# EasyEDA Pro project v0.9.0.epro, schematic main_5

## Sheets
1 main: Board Name: tf_mux-v0.0.8-rc4; Create Date: 2025-06-03; Page Name: main; Project Name: sd_mux; Schematic Name: main_2; Update Date: 2025-07-14; Company: Ling Wang; Page Size: A4; Version: V0.8
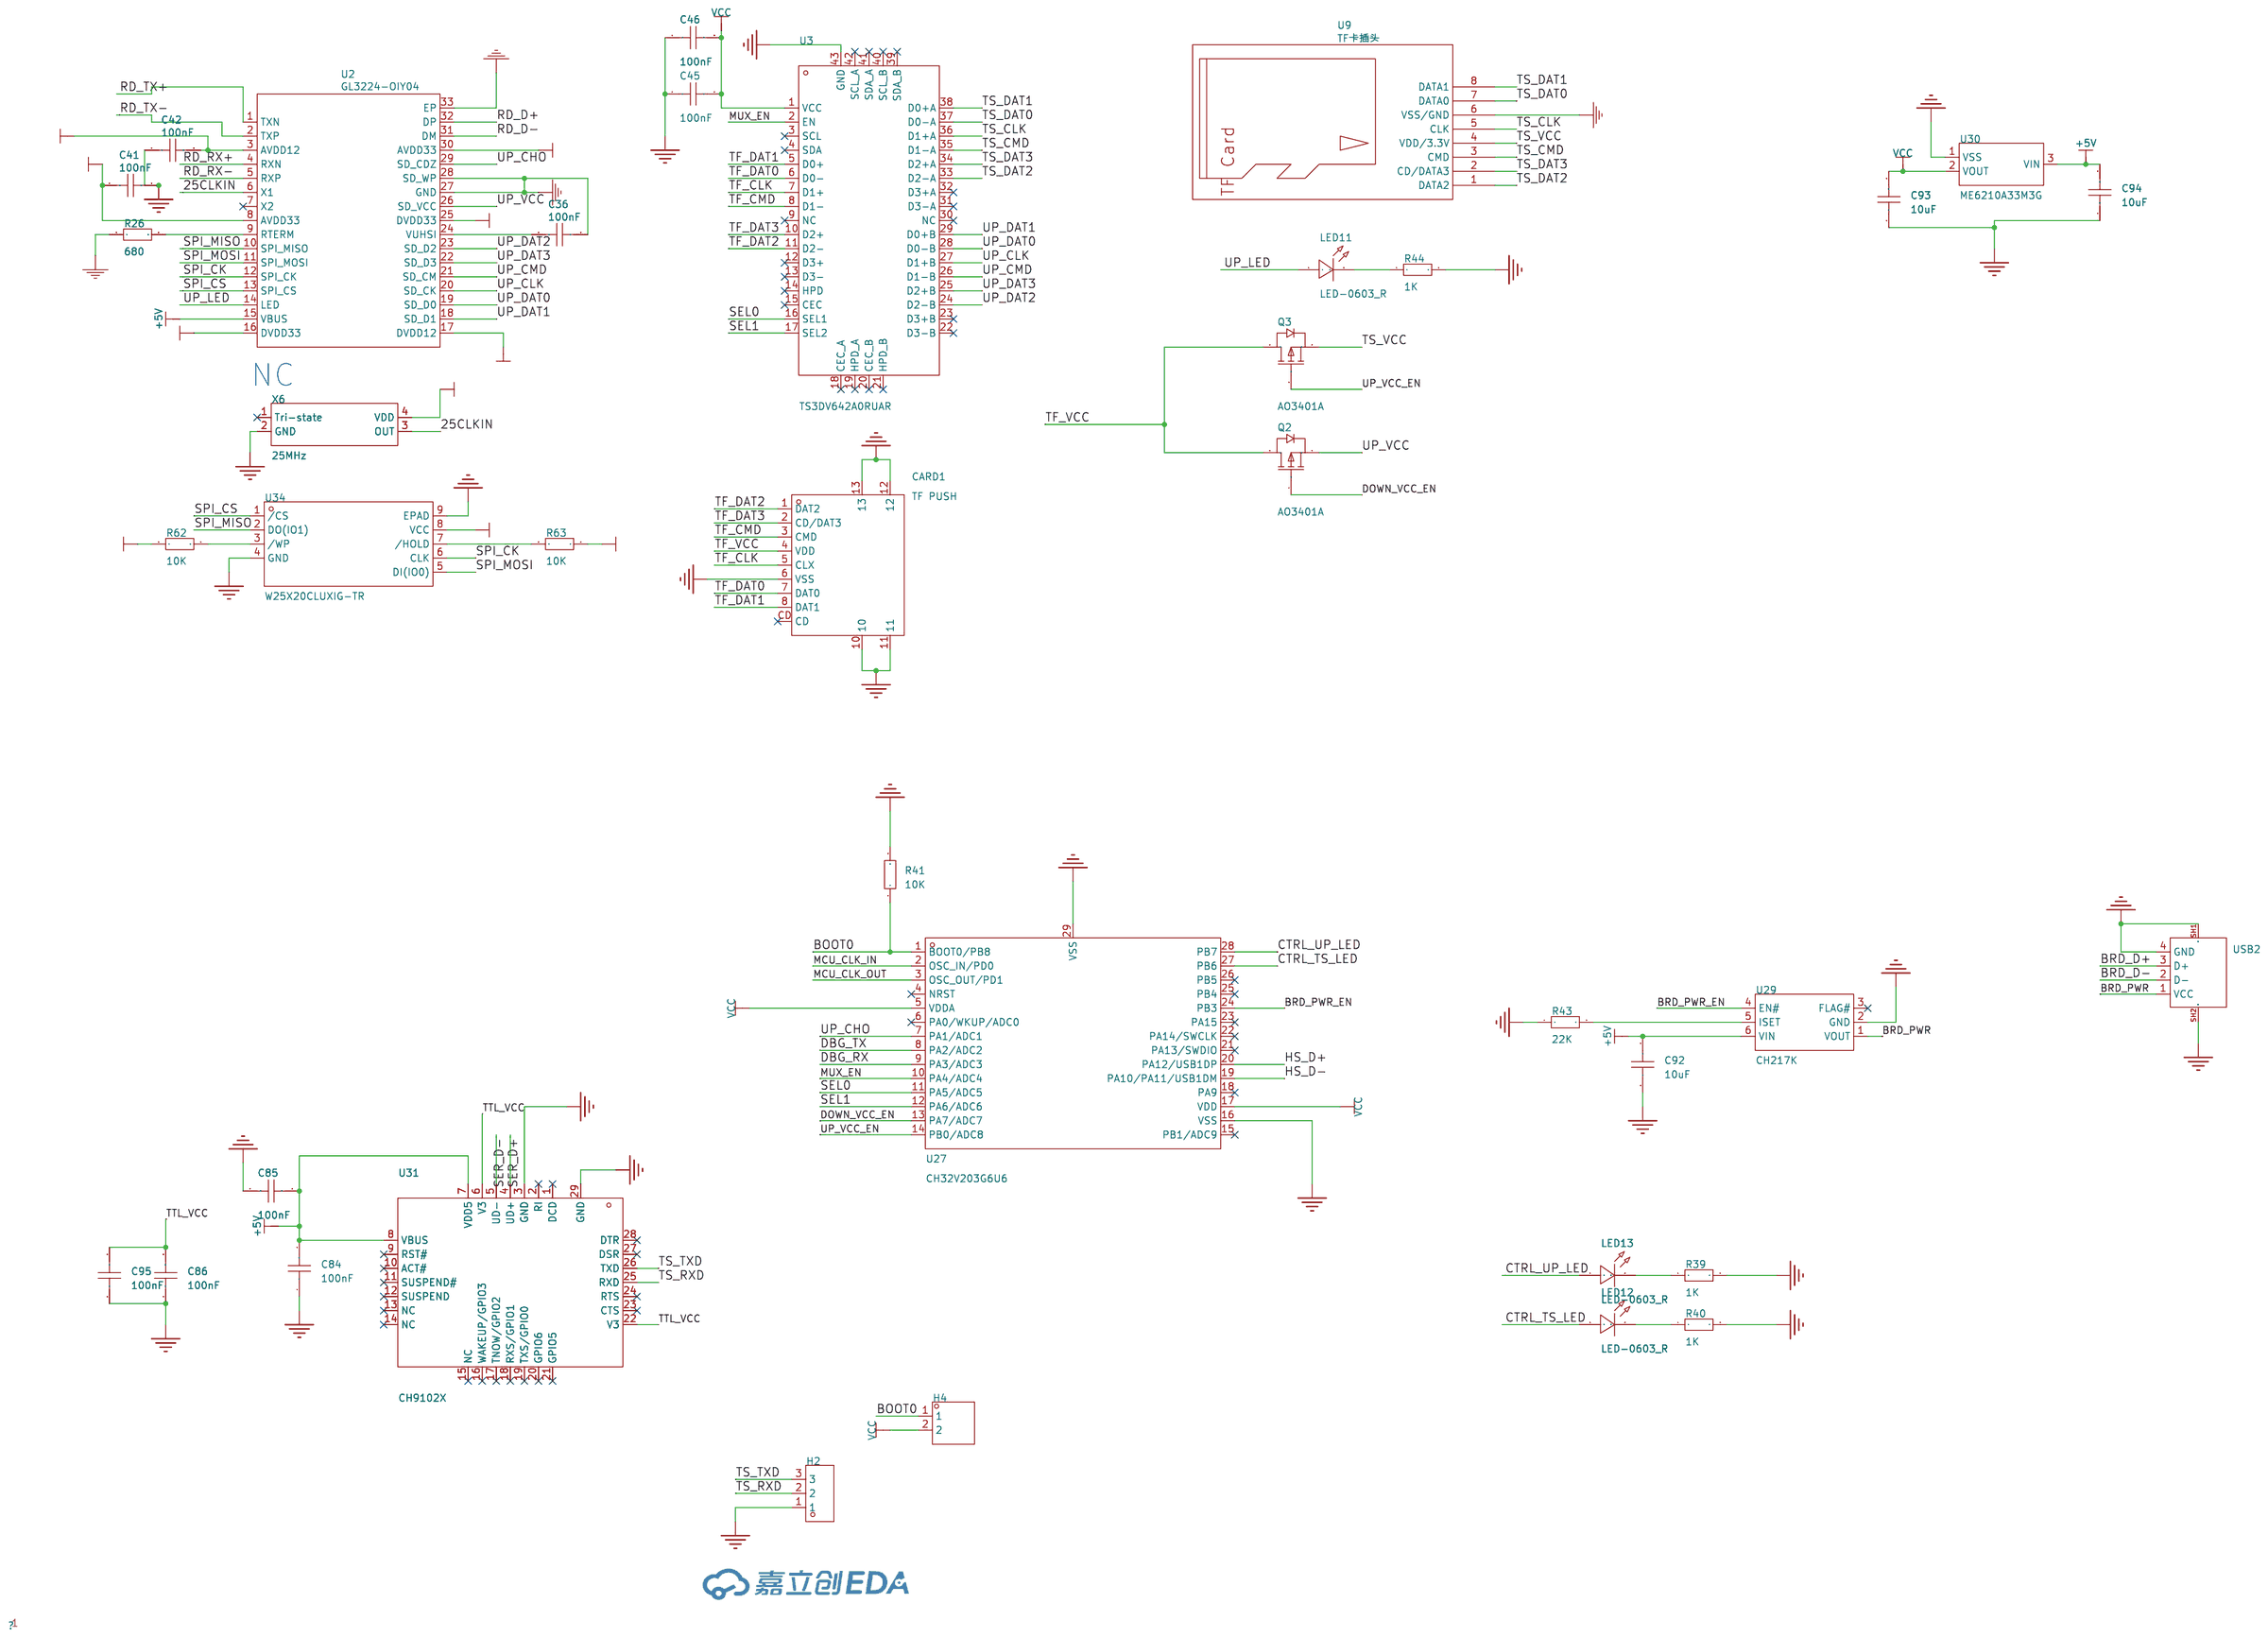
[diagram p0: main]
2 typec: Board Name: tf_mux-v0.0.9-b; Create Date: 2025-08-06; Page Name: typec; Schematic Name: main_5; Update Date: 2025-08-07; Company: 嘉立创EDA; Version: V1.0
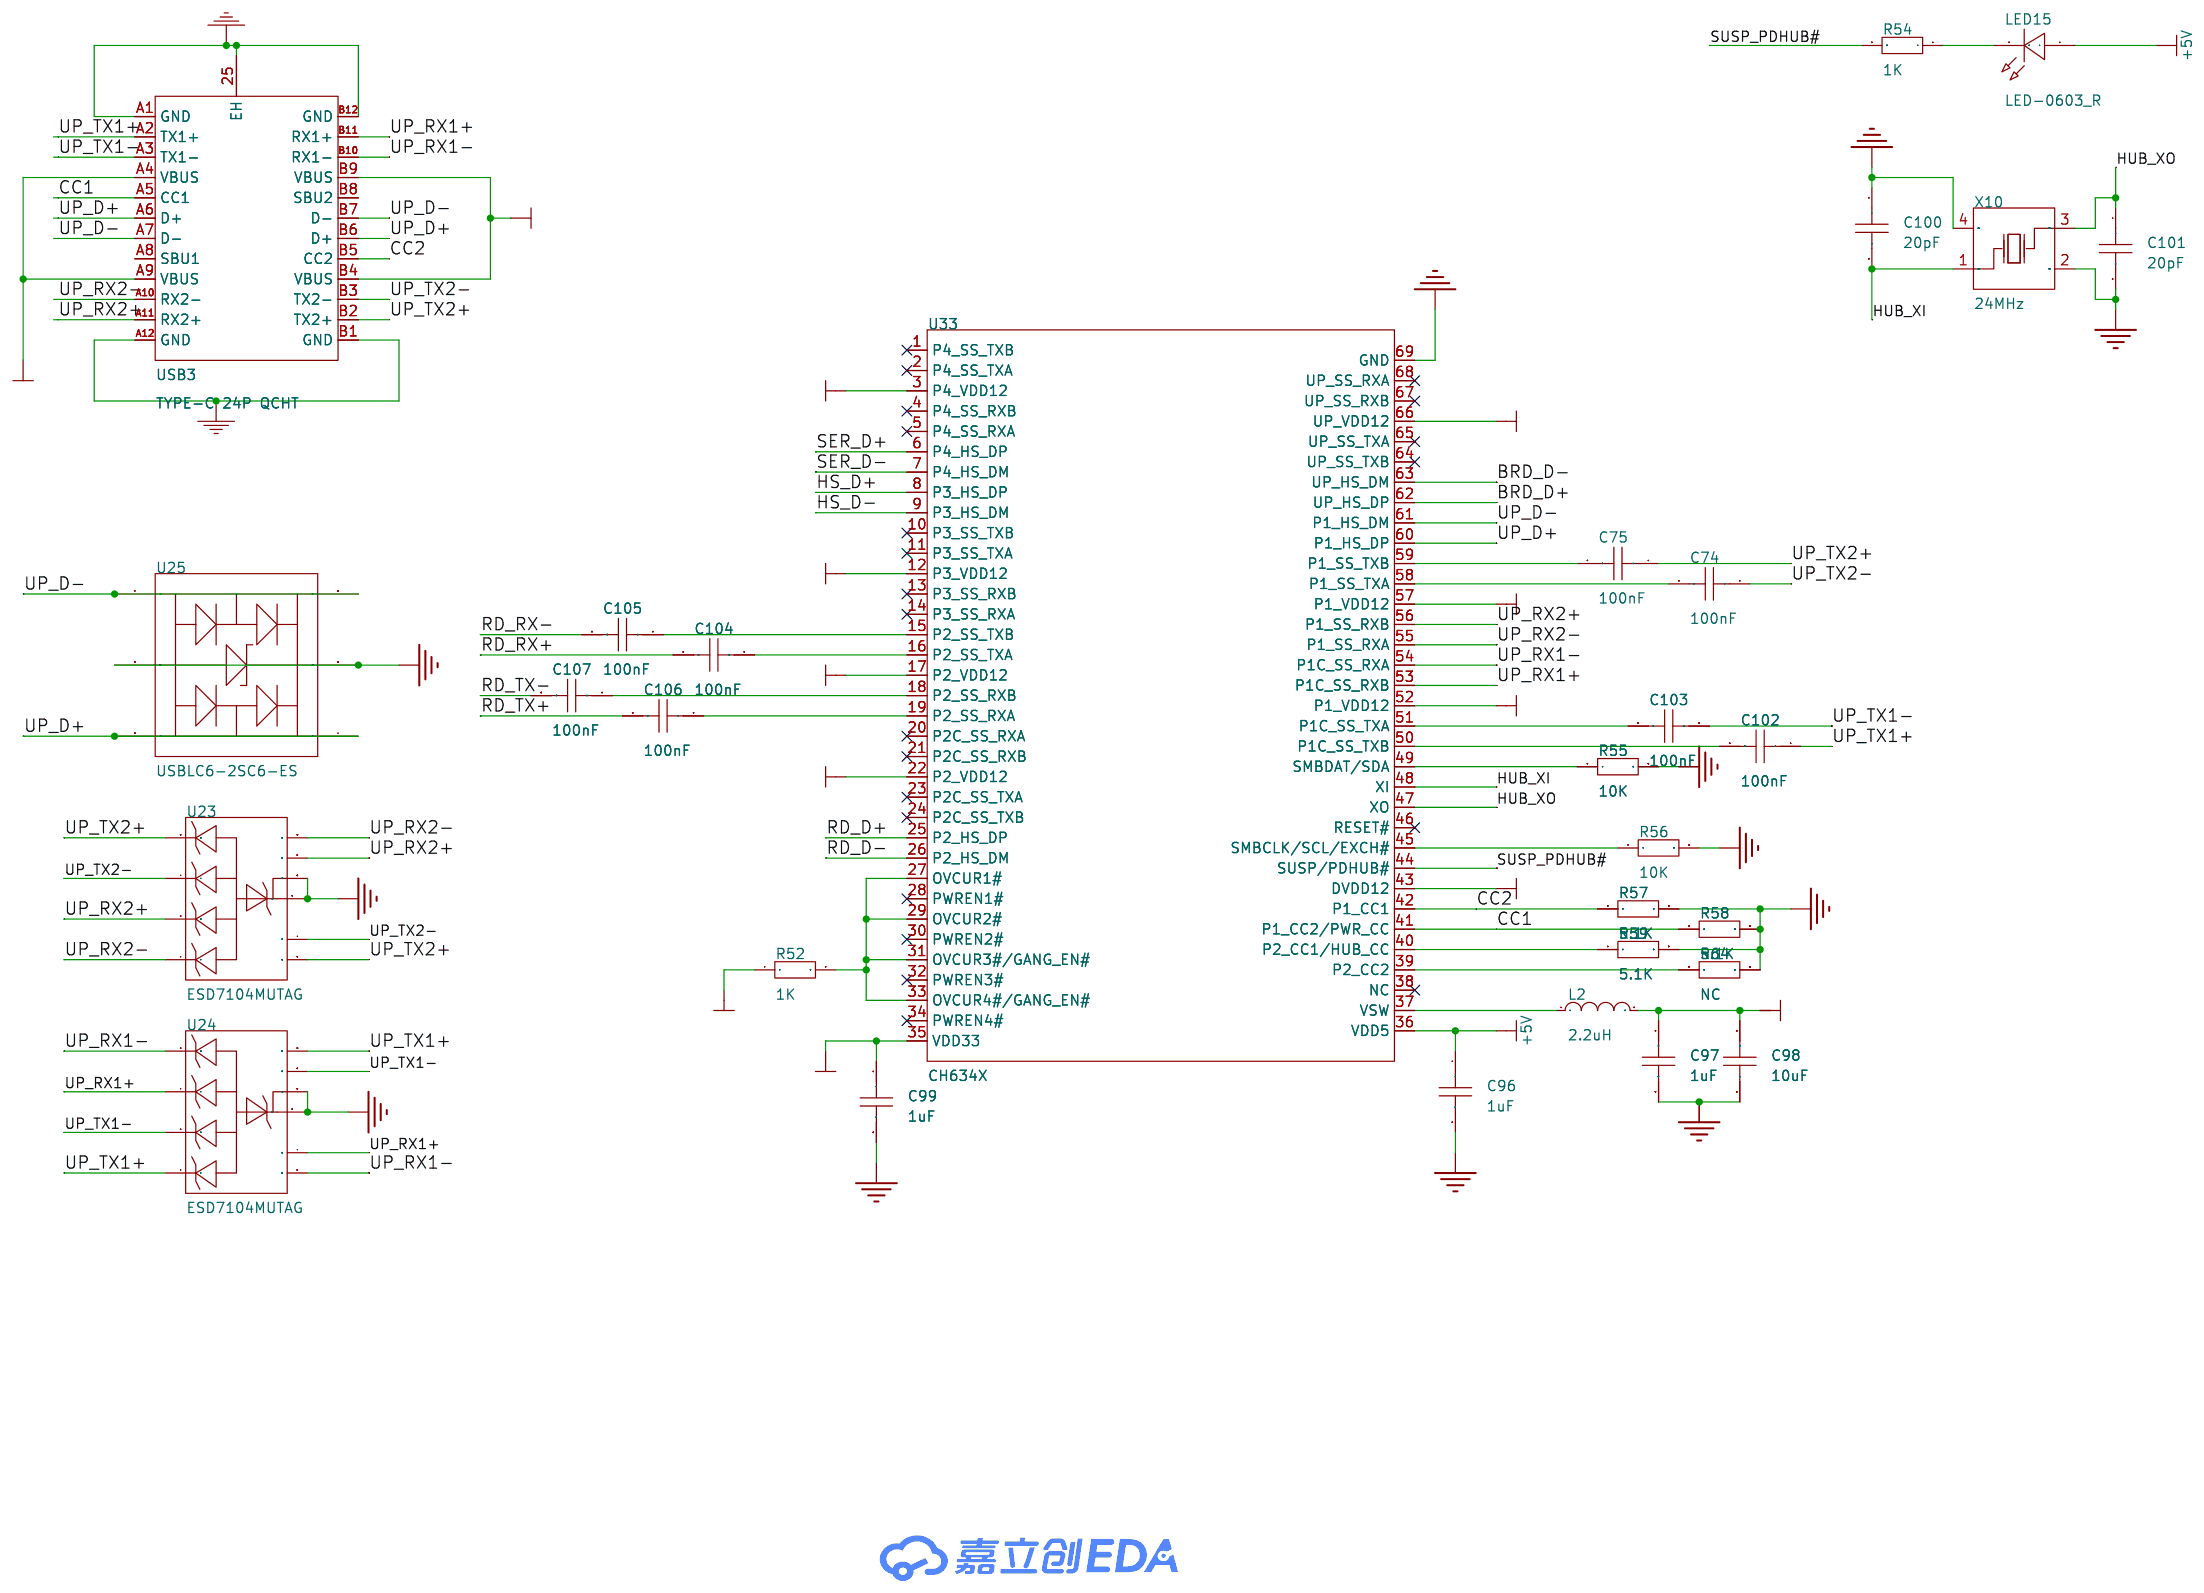
[diagram p1: typec]

## Parts
sheet main
C36  100nF  [C0603]
C41  100nF  [C0603]
C42  100nF  [C0603]
C45  100nF  [C0603]
C46  100nF  [C0603]
C84  100nF  [C0603]
C85  100nF  [C0603]
C86  100nF  [C0603]
C92  10uF  [C0603]
C93  10uF  [C0603]
C94  10uF  [C0603]
C95  100nF  [C0603]  (no BOM)
CARD1  TF PUSH  [TF-SMD_TF-PUSH]
H2  -  [HDR-TH_3P-P2.54-V-M]  (no BOM)
H4  -  [HDR-TH_2P-P2.54-V-M-1]  (no BOM)
LED11  LED-0603_R  [LED0603_RED]
LED12  LED-0603_R  [LED0603_RED]
LED13  LED-0603_R  [LED0603_RED]
Q2  AO3401A  [SOT-23_L2.9-W1.3-P1.90-LS2.4-BR]
Q3  AO3401A  [SOT-23_L2.9-W1.3-P1.90-LS2.4-BR]
R26  680  [R0603]
R39  1K  [R0603]
R40  1K  [R0603]
R41  10K  [R0603]
R43  22K  [R0603]
R44  1K  [R0603]
R62  10K  [R0603]
R63  10K  [R0603]
U2  GL3224-OIY04  [HQFN-32_L5.0-W5.0-P0.50-BL-EP3.0]
U3  TS3DV642A0RUAR  [WFQFN-42_L9.0-W3.5-P0.50-BL-EP]
U9  TF卡插头  [TF卡封装]  (no BOM)
U27  CH32V203G6U6  [QFN-28_L4.0-W4.0-P0.40-BL-EP2.7]
U29  CH217K  [SOT-23-6_L2.9-W1.6-P0.95-LS2.8-BL]
U30  ME6210A33M3G  [SOT-23-3_L3.0-W1.7-P0.95-LS2.9-BR]
U31  CH9102X  [TQFN-28_L5.0-W5.0-P0.50-BL-EP2.7]
U34  W25X20CLUXIG-TR  [USON8_L3.0-W2.0-P0.50-TL-EP]
USB2  -  [USB_ Type-A]
X6  25MHz  [OSC-SMD_4P-L2.5-W2.0-BL-1]  (no BOM)
sheet typec
C74  100nF  [C0402]
C75  100nF  [C0402]
C96  1uF  [C0603]
C97  1uF  [C0603]
C98  10uF  [C0603]
C99  1uF  [C0603]
C100  20pF  [C0603]
C101  20pF  [C0603]
C102  100nF  [C0402]
C103  100nF  [C0402]
C104  100nF  [C0402]
C105  100nF  [C0402]
C106  100nF  [C0402]
C107  100nF  [C0402]
L2  2.2uH  [IND-SMD_L2.5-W2.0_MHCHL2520]
LED15  LED-0603_R  [LED0603_RED]
R52  1K  [R0603]
R54  1K  [R0603]
R55  10K  [R0603]
R56  10K  [R0603]
R57  5.1K  [R0603]
R58  5.1K  [R0603]
R59  5.1K  [R0603]
R64  NC  [R0603]
U23  ESD7104MUTAG  [DFN-10_L2.5-W1.0-P0.50-BL]
U24  ESD7104MUTAG  [DFN-10_L2.5-W1.0-P0.50-BL]
U25  USBLC6-2SC6-ES  [SOT-23-6_L2.9-W1.6-P0.95-LS2.8-BR]
U33  CH634X  [QFN-68_L8.0-W8.0-P0.40-BL-EP6.2]
USB3  TYPE-C 24P QCHT  [TYPE-C-SMD_TYPE-C-24P-QCHT]
X10  24MHz  [CRYSTAL-SMD_4P-L3.2-W2.5-BL]

## Library data of the parts
C36 C41 C42 C45 C46 C84-C86 C92 C95-C101 = CAP_0603: Supplier Footprint: 0603
C74 C75 C93 C94 C102-C107 = CAP_0402: Supplier Footprint: 0402
CARD1 = TF PUSH: 卡连接方式:自弹式;卡类型:MicroSD卡(TF卡);连接器类型:卡座;本体最大高度:2mm;工作温度范围:-20℃~+90℃;; LCSC Part Name: 自弹式 MicroSD卡(TF卡) 卡座; Supplier Part: C393941; Manufacturer: SHOU HAN(首韩); Supplier Footprint: SMD; JLCPCB Part Class: 扩展库; Datasheet: https://atta.szlcsc.com/upload/public/pdf/source/20191011/C393941_0DDD896EE907FEB750D8B7B8982E2A67.pdf; Supplier: LCSC; Card Connection Mode: 自弹式; Card Type: MicroSD卡(TF卡); Connector Type: 卡座; Additional Card Detection Pins: 无; Maximum Body Height: 2mm; Operating Temperature Range: -20℃~+90℃
H2 = HDR-M_2.54_1x3P: Supplier Part: C2937625; Supplier Footprint: 插件
H4 = HDR-M_2.54_1x2P: Supplier Part: C124375; Supplier Footprint: 插件
LED11-LED13 LED15 = LED-0603_R: Manufacturer: EVERLIGHT(台湾亿光); Manufacturer Part: 19-217/R6C-AL1M2VY/3T; Supplier Part: C72044; Supplier: LCSC
Q2 Q3 = AO3401A_C15127: 类型:1个P沟道;漏源电压(Vdss):30V;连续漏极电流(Id):4A;导通电阻(RDS(on)@Vgs,Id):44mΩ@10V,4.3A;功率(Pd):1.4W;阈值电压(Vgs(th)@Id):1.3V@250uA;; LCSC Part Name: 1个P沟道 耐压:30V 电流:4A; Supplier Part: C15127; Manufacturer: AOS; Supplier Footprint: SOT-23; JLCPCB Part Class: 基础库; Datasheet: https://atta.szlcsc.com/upload/public/pdf/source/20160507/1462613609053.pdf; Supplier: LCSC; Type: 1个P沟道; Drain Source Voltage (Vdss): 30V; Continuous Drain Current (Id): 4A; Drain Source On Resistance (RDS(on)@Vgs,Id): 44mΩ@10V,4.3A; Power Dissipation (Pd): 1.4W; Gate Threshold Voltage (Vgs(th)@Id): 1.3V@250uA; Total Gate Charge (Qg@Vgs): 12.2nC@4.5V; Input Capacitance (Ciss@Vds): 1.2nF@15V; Operating Temperature: -55℃~+150℃@(Tj)
R26 R39-R41 R43 R44 R52 R54-R59 R62-R64 = Res_0603: Supplier Footprint: 0603
U2 = GL3224-OIY04: Supplier: LCSC; Supplier Part: C157357; Manufacturer: GENESYS(创惟); JLCPCB Part Class: Extended Part
U3 = TS3DV642A0RUAR: 开关电路:单刀双掷(SPDT);通道数:12;导通电阻(Ron@VCC):9.5Ω;; LCSC Part Name: 具有1.8V兼容控制和断电模式的12通道1:2多路复用器/多路解复用器; Supplier Part: C157482; Manufacturer: TI(德州仪器); Supplier Footprint: WFQFN-42-EP(3.5x9); JLCPCB Part Class: 扩展库; Datasheet: https://www.ti.com/cn/lit/gpn/ts3dv642; Supplier: LCSC; Switch Circuit: 单刀双掷(SPDT); Number of Channels: 12; Supply Voltage: 2.6V~4.5V; Turn-on time: 100ns; On-State Resistance (Max): 9.5Ω; Operating Temperature: -40℃~+85℃
U9 = TF卡插头: Supplier: HeZo
U27 = CH32V203G6U6: CPU内核:RISC-V;GPIO端口数量:-;工作电压范围:-;CPU最大主频:-;程序存储器类型:-;应用领域:-;; Supplier Part: C5142280; Manufacturer: WCH(南京沁恒); Supplier Footprint: QFN28X4; JLCPCB Part Class: 扩展库; Datasheet: https://atta.szlcsc.com/upload/public/pdf/source/20230523/1B381532B53560847D0152FAE396CF1C.pdf; Supplier: LCSC; CPU Core: RISC-V
U29 = CH217K: 类型:负载开关;通道数:1;输入控制逻辑:低电平有效;输出电流:2.7A;工作电压:2.7V~5.5V;导通电阻:70mΩ;; LCSC Part Name: USB 限流配电开关芯片; Supplier Part: C7462749; Manufacturer: WCH(南京沁恒); Supplier Footprint: SOT-23-6; JLCPCB Part Class: 扩展库; Datasheet: https://atta.szlcsc.com/upload/public/pdf/source/20240614/C0960F2CAA1F151A0DBC53501BDEDFC6.pdf; Supplier: LCSC; Type: 负载开关; Number of Channels: 1; Control Input Logic: 低电平有效; Output Current: 2.7A; Voltage - Supply: 2.7V~5.5V; RDS(on): 70mΩ; Operating Temperature	-: -40℃~+85℃
U30 = ME6210A33M3G: 输出类型:固定;工作电压:18V;输出电压:3.3V;输出电流:500mA;电源纹波抑制比(PSRR):-;输出极性:正极;; LCSC Part Name: 输入18V 输出3.3V 500mA; Supplier Part: C236680; Manufacturer: MICRONE(南京微盟); Supplier Footprint: SOT-23; JLCPCB Part Class: 扩展库; Datasheet: https://atta.szlcsc.com/upload/public/pdf/source/20190709/C403652_164B03470289BC6E2EF0FCF22B47472A.pdf; Supplier: LCSC; Output Type: 固定; Voltage - Supply: 18V; Output Voltage: 3.3V; Output Current: 500mA; Voltage Dropout: 260mV@(200mA); Features: 短路保护(SCP)；低ESR; Output Configuration: 正极; Number of Outputs: 1
U31 = CH9102X_C5187522: 应用功能:USB转UART;接口协议:USB 2.0;通道数:-;数据速率:4Mbps;; LCSC Part Name: USB转串口芯片CH9102; Supplier Part: C5187522; Manufacturer: WCH(南京沁恒); Supplier Footprint: QFN-28(5x5); JLCPCB Part Class: 扩展库; Datasheet: https://atta.szlcsc.com/upload/public/pdf/source/20240313/AF0D9A0C8A705CD7DAC68F5AA4A0187A.pdf; Supplier: LCSC; Applications Function: USB转UART; Protocol: USB 2.0; Supply Voltage: 3.3V; Data Rate: 4Mbps; Operating Temperature: -40℃~+85℃
U34 = W25X20CLUXIG-TR: 接口类型:SPI;存储容量:-;时钟频率(fc):104MHz;; Supplier Part: C164121; Manufacturer: WINBOND(华邦); Supplier Footprint: USON8-EP(2x3); JLCPCB Part Class: 扩展库; Datasheet: https://atta.szlcsc.com/upload/public/pdf/source/20210923/C2456311_703401DAC377E7A0044453CBE88366C8.pdf; Supplier: LCSC; Interface: SPI; Clock Frequency: 104MHz; Voltage - Supply: 2.3V~3.6V; Page Programming Time (Tpp): 400us; Data Retention - TDR (Year): 20年; Operating Temperature: -40℃~+85℃
USB2 = USB_ Type-A: Supplier Footprint: 插件
X6 = OT252025MJBA4SL: 频率:25MHz;常温频差:±10ppm;输出模式:CMOS;工作电压:1.8V~3.3V;频率稳定度:±20ppm;; LCSC Part Name: 25MHz ±10ppm 1.8V~3.3V YSO110TR; Supplier Part: C717683; Manufacturer: YXC(扬兴晶振); Supplier Footprint: SMD2520-4P; JLCPCB Part Class: 扩展库; Datasheet: https://atta.szlcsc.com/upload/public/pdf/source/20240731/596E5F7673E50DA744B7F79F139FB8DF.pdf; Supplier: LCSC; Normal temperature Frequency Tolerance: ±10ppm; Output Type: CMOS; Voltage - Supply: 1.8V~3.3V; Frequency Stability: ±20ppm; Operating Temperature: -40℃~+85℃
L2 = FTC252012S2R2MBCA: 电感值:2.2uH;精度:±20%;额定电流:3A;饱和电流(Isat):3.8A;类型:一体成型电感;; LCSC Part Name: 2.2uH ±20% 3.8A; Supplier Part: C5832372; Manufacturer: cjiang(长江微电); Supplier Footprint: 1008; JLCPCB Part Class: 扩展库; Datasheet: https://atta.szlcsc.com/upload/public/pdf/source/20230602/8FFEDA9C0247A92A0D4B67554BFE4091.pdf; Supplier: LCSC; Tolerance: ±20%; Rated Current: 3A; Saturation Current (Isat): 3.8A; DC Resistance (DCR): 55mΩ; Type: 一体成型电感
U23 U24 = ESD7104MUTAG_C2987068: Supplier Part: C2987068; Manufacturer: TECH PUBLIC(台舟); Supplier Footprint: DFN2510-10; JLCPCB Part Class: 扩展库; Datasheet: https://atta.szlcsc.com/upload/public/pdf/source/20220406/15BE93029AF18516FD2D3EF71F325366.pdf; Supplier: LCSC
U25 = USBLC6-2SC6-ES: 极性:单向;反向截止电压(Vrwm):5V;钳位电压:15V;峰值脉冲电流(Ipp):4.5A;峰值脉冲功率(Ppp):-;击穿电压:6V;; LCSC Part Name: 4路单向+带VBUS防护ESD静电防护器件，20kV，CJ：0.6pF；HDMI/USB/RJ45高速接口通讯防护; Supplier Part: C5180249; Manufacturer: ElecSuper(静芯微); Supplier Footprint: SOT23-6; JLCPCB Part Class: 扩展库; Datasheet: https://atta.szlcsc.com/upload/public/pdf/source/20240905/A8F5201896DEAFE87716A4B2E209A025.pdf; Supplier: LCSC; Polarity: 单向; Reverse Stand-Off Voltage (Vrwm): 5V; Clamping Voltage: 15V; Peak Pulse Current (Ipp): 4.5A; Voltage - Breakdown: 6V; Reverse Leakage Current (Ir): 1uA; Number of Channels: 双路; Type: ESD
U33 = CH634X_C48985831: 符合USB3.2 Gen1协议规范的4端口USB超高速HUB控制器芯片,CH634X内置两组Type-C双通道USB3.0 PHY和双PD PHY，原生支持Type-C正反插自适应，原生支持PDHUB、Type-C15W和PD100W快充。; Supplier Part: C48985831; Manufacturer: WCH(南京沁恒); Supplier Footprint: QFN-68(8x8); JLCPCB Part Class: 扩展库; Datasheet: https://atta.szlcsc.com/upload/public/pdf/source/20250427/837740E6CDDDF670742DBF4DF47E1928.pdf; Supplier: LCSC
USB3 = TYPE-C 24P QCHT: 连接器类型:Type-C;标准:USB 3.1;公母:母;安装方式:卧贴;触点数量:24P;端口数量:1;额定电流 - 电源:3A;工作温度范围:-40℃~+85℃;; LCSC Part Name: Type-C 母 卧贴; Supplier Part: C456013; Manufacturer: SHOU HAN(首韩); Supplier Footprint: SMD; JLCPCB Part Class: 扩展库; Datasheet: https://atta.szlcsc.com/upload/public/pdf/source/20191113/C456013_92427D6B1C851D10A4627E39D5976A1B.pdf; Supplier: LCSC; Connector Type: Type-C; Standard: USB 3.1; Gender: 母; Mounting Style: 卧贴; Number of Contacts: 24P; Number of Ports: 1; Current Rating - Power (Max): 3A; Operating Temperature Range: -40℃~+85℃; Rated Voltage (Max): 30V; Connect-Disconnect Life: 1万次; Core Colour: 黑色
X10 = X322524MSB4SI: 晶振类型:贴片无源晶振;频率:24MHz;频率公差:±10ppm;频率稳定度:±30ppm;负载电容:20pF;工作温度:-40℃~+85℃;; LCSC Part Name: YSX321SL 24MHz ±10ppm 20pF; Supplier Part: C15643; Manufacturer: YXC(扬兴科技); Supplier Footprint: SMD3225-4P; JLCPCB Part Class: Extended Part; Datasheet: https://atta.szlcsc.com/upload/public/pdf/source/20210329/C112971_1F611BDC486E193C1706F6D8EB5AA189.pdf; Supplier: LCSC; Crystal Type: 贴片无源晶振; Frequency Tolerance: ±10ppm; Frequency Stability: ±30ppm; Load Capacitance: 20pF; Operating Temperature: -40℃~+85℃

## Nets
+5V: C84.2 C85.1 C92.1 C94.2 C96.1 LED15.1 U2.15(VBUS) U29.6(VIN) U30.3(VIN) U31.7(VDD5) U31.8(VBUS) U33.36(VDD5) USB3.A4(VBUS) USB3.A9(VBUS) USB3.B4(VBUS) USB3.B9(VBUS)
GND: C36.2 C41.2 C42.1 C45.1 C46.1 C84.1 C85.2 C86.1 C92.2 C93.1 C94.1 C95.1 C96.2 C97.2 C98.2 C99.2 C100.1 C101.2 CARD1.6(VSS) CARD1.10 CARD1.11 CARD1.12 CARD1.13 H2.1 R26.1 R39.2 R40.2 R41.2 R43.1 R44.2 R55.2 R56.2 R57.2 R58.2 R59.2 R64.2 U2.27(GND) U2.28(SD_WP) U2.33(EP) U3.43(GND) U9.6(VSS/GND) U23.3 U23.8 U24.3 U24.8 U25.2(GND) U25.5(VCC) U27.16(VSS) U27.29(VSS) U29.2(GND) U30.1(VSS) U31.3(GND) U31.29(GND) U33.69(GND) U34.4(GND) U34.9(EPAD) USB2.4(GND) USB2.SH1 USB2.SH2 USB3.25(EH) USB3.A1(GND) USB3.A12(GND) USB3.B1(GND) USB3.B12(GND) X6.2(GND) X10.2(GND) X10.4(GND)
VCC: C45.2 C46.2 C93.2 H4.2 U3.1(VCC) U27.5(VDDA) U27.17(VDD) U30.2(VOUT)
25CLKIN: U2.6(X1) X6.3(OUT)
BOOT0: H4.1 R41.1 U27.1(BOOT0/PB8)
BRD_D+: U33.62(UP_HS_DP) USB2.3(D+)
BRD_D-: U33.63(UP_HS_DM) USB2.2(D-)
BRD_PWR: U29.1(VOUT) USB2.1(VCC)
BRD_PWR_EN: U27.24(PB3) U29.4(EN#)
CC1: R58.1 U33.41(P1_CC2/PWR_CC) USB3.A5(CC1)
CC2: R57.1 U33.42(P1_CC1) USB3.B5(CC2)
CTRL_TS_LED: LED12.1 U27.27(PB6)
CTRL_UP_LED: LED13.1 U27.28(PB7)
DBG_RX: U27.9(PA3/ADC3)
DBG_TX: U27.8(PA2/ADC2)
DOWN_VCC_EN: Q2.1(G) U27.13(PA7/ADC7)
HS_D+: U27.20(PA12/USB1DP) U33.8(P3_HS_DP)
HS_D-: U27.19(PA10/PA11/USB1DM) U33.9(P3_HS_DM)
HUB_1V2: C97.1 C98.1 L2.2 U33.3(P4_VDD12) U33.12(P3_VDD12) U33.17(P2_VDD12) U33.22(P2_VDD12) U33.43(DVDD12) U33.52(P1_VDD12) U33.57(P1_VDD12) U33.66(UP_VDD12)
HUB_3V3: C99.1 R52.1 U33.35(VDD33)
HUB_XI: C100.2 U33.48(XI) X10.1(OSC1)
HUB_XO: C101.1 U33.47(XO) X10.3(OSC2)
MCU_CLK_IN: U27.2(OSC_IN/PD0)
MCU_CLK_OUT: U27.3(OSC_OUT/PD1)
MUX_EN: U3.2(EN) U27.10(PA4/ADC4)
RD_1V2: C42.2 U2.3(AVDD12) U2.17(DVDD12)
RD_D+: U2.32(DP) U33.25(P2_HS_DP)
RD_D-: U2.31(DM) U33.26(P2_HS_DM)
RD_RX+: C104.2 U2.4(RXN)
RD_RX-: C105.2 U2.5(RXP)
RD_TX+: C106.2 U2.1(TXN)
RD_TX-: C107.2 U2.2(TXP)
RD_VCC: C41.1 R62.1 R63.2 U2.8(AVDD33) U2.16(DVDD33) U2.25(DVDD33) U2.30(AVDD33) U34.8(VCC) X6.4(VDD)
SEL0: U3.16(SEL1) U27.11(PA5/ADC5)
SEL1: U3.17(SEL2) U27.12(PA6/ADC6)
SER_D+: U31.4(UD+) U33.6(P4_HS_DP)
SER_D-: U31.5(UD-) U33.7(P4_HS_DM)
SPI_CK: U2.12(SPI_CK) U34.6(CLK)
SPI_CS: U2.13(SPI_CS) U34.1(/CS)
SPI_MISO: U2.10(SPI_MISO) U34.2(DO(IO1))
SPI_MOSI: U2.11(SPI_MOSI) U34.5(DI(IO0))
SUSP_PDHUB#: R54.2 U33.44(SUSP/PDHUB#)
TF_CLK: CARD1.5(CLX) U3.7(D1+)
TF_CMD: CARD1.3(CMD) U3.8(D1-)
TF_DAT0: CARD1.7(DAT0) U3.6(D0-)
TF_DAT1: CARD1.8(DAT1) U3.5(D0+)
TF_DAT2: CARD1.1(DAT2) U3.11(D2-)
TF_DAT3: CARD1.2(CD/DAT3) U3.10(D2+)
TF_VCC: CARD1.4(VDD) Q2.3(D) Q3.3(D)
TS_CLK: U3.36(D1+A) U9.5(CLK)
TS_CMD: U3.35(D1-A) U9.3(CMD)
TS_DAT0: U3.37(D0-A) U9.7(DATA0)
TS_DAT1: U3.38(D0+A) U9.8(DATA1)
TS_DAT2: U3.33(D2-A) U9.1(DATA2)
TS_DAT3: U3.34(D2+A) U9.2(CD/DATA3)
TS_RXD: H2.2 U31.25(RXD)
TS_TXD: H2.3 U31.26(TXD)
TS_VCC: Q3.2(S) U9.4(VDD/3.3V)
TTL_VCC: C86.2 C95.2 U31.6(V3) U31.22(V3)
UP_CHO: U2.29(SD_CDZ) U27.7(PA1/ADC1)
UP_CLK: U2.20(SD_CK) U3.27(D1+B)
UP_CMD: U2.21(SD_CM) U3.26(D1-B)
UP_D+: U25.3(I/O2) U25.4(I/O2) U33.60(P1_HS_DP) USB3.A6(D+) USB3.B6(D+)
UP_D-: U25.1(I/O1) U25.6(I/O1) U33.61(P1_HS_DM) USB3.A7(D-) USB3.B7(D-)
UP_DAT0: U2.19(SD_D0) U3.28(D0-B)
UP_DAT1: U2.18(SD_D1) U3.29(D0+B)
UP_DAT2: U2.23(SD_D2) U3.24(D2-B)
UP_DAT3: U2.22(SD_D3) U3.25(D2+B)
UP_LED: LED11.1 U2.14(LED)
UP_RX1+: U24.4 U24.7(NC) U33.53(P1C_SS_RXB) USB3.B11(RX1+)
UP_RX1-: U24.5 U24.6(NC) U33.54(P1C_SS_RXA) USB3.B10(RX1-)
UP_RX2+: U23.2 U23.9(NC) U33.56(P1_SS_RXB) USB3.A11(RX2+)
UP_RX2-: U23.1 U23.10(NC) U33.55(P1_SS_RXA) USB3.A10(RX2-)
UP_TX1+: C102.1 U24.1 U24.10(NC) USB3.A2(TX1+)
UP_TX1-: C103.1 U24.2 U24.9(NC) USB3.A3(TX1-)
UP_TX2+: C75.1 U23.5 U23.6(NC) USB3.B2(TX2+)
UP_TX2-: C74.1 U23.4 U23.7(NC) USB3.B3(TX2-)
UP_VCC: Q2.2(S) U2.26(SD_VCC)
UP_VCC_EN: Q3.1(G) U27.14(PB0/ADC8)
$1N442: R26.2 U2.9(RTERM)
$1N469: C36.1 U2.24(VUHSI)
$1N1150: LED11.2 R44.1
$1N18923: LED13.2 R39.1
$1N18990: LED12.2 R40.1
$1N41303: R43.2 U29.5(ISET)
$1N58947: R63.1 U34.7(/HOLD)
$1N58951: R62.2 U34.3(/WP)
$2N12665: L2.1 U33.37(VSW)
$2N12685: R52.2 U33.27(OVCUR1#) U33.29(OVCUR2#) U33.31(OVCUR3#/GANG_EN#) U33.33(OVCUR4#/GANG_EN#)
$2N12693: LED15.2 R54.1
$2N12701: R55.1 U33.49(SMBDAT/SDA)
$2N12705: R56.1 U33.45(SMBCLK/SCL/EXCH#)
$2N12808: C75.2 U33.59(P1_SS_TXB)
$2N12812: C74.2 U33.58(P1_SS_TXA)
$2N12880: C103.2 U33.51(P1C_SS_TXA)
$2N12884: C102.2 U33.50(P1C_SS_TXB)
$2N14097: C105.1 U33.15(P2_SS_TXB)
$2N14098: C104.1 U33.16(P2_SS_TXA)
$2N14147: C107.1 U33.18(P2_SS_RXB)
$2N14148: C106.1 U33.19(P2_SS_RXA)
$2N16031: R59.1 U33.40(P2_CC1/HUB_CC)
$2N16694: R64.1 U33.39(P2_CC2)

Not connected (* = marked no-connect by the designer): CARD1 CD*; U2 7(X2)*; U3 3(SCL)* 4(SDA)* 9(NC)* 12(D3+)* 13(D3-)* 14(HPD)* 15(CEC)* 18(CEC_A)* 19(HPD_A)* 20(CEC_B)* 21(HPD_B)* 22(D3-B)* 23(D3+B)* 30(NC)* 31(D3-A)* 32(D3+A)* 39(SDA_B)* 40(SCL_B)* 41(SDA_A)* 42(SCL_A)*; U27 4(NRST)* 6(PA0/WKUP/ADC0)* 15(PB1/ADC9)* 18(PA9)* 21(PA13/SWDIO)* 22(PA14/SWCLK)* 23(PA15)* 25(PB4)* 26(PB5)*; U29 3(FLAG#)*; U31 1(DCD)* 2(RI)* 9(RST#)* 10(ACT#)* 11(SUSPEND#)* 12(SUSPEND)* 13(NC)* 14(NC)* 15(NC)* 16(WAKEUP/GPIO3)* 17(TNOW/GPIO2)* 18(RXS/GPIO1)* 19(TXS/GPIO0)* 20(GPIO6)* 21(GPIO5)* 23(CTS)* 24(RTS)* 27(DSR)* 28(DTR)*; U33 1(P4_SS_TXB)* 2(P4_SS_TXA)* 4(P4_SS_RXB)* 5(P4_SS_RXA)* 10(P3_SS_TXB)* 11(P3_SS_TXA)* 13(P3_SS_RXB)* 14(P3_SS_RXA)* 20(P2C_SS_RXA)* 21(P2C_SS_RXB)* 23(P2C_SS_TXA)* 24(P2C_SS_TXB)* 28(PWREN1#)* 30(PWREN2#)* 32(PWREN3#)* 34(PWREN4#)* 38(NC)* 46(RESET#)* 64(UP_SS_TXB)* 65(UP_SS_TXA)* 67(UP_SS_RXB)* 68(UP_SS_RXA)*; USB3 A8(SBU1) B8(SBU2); X6 1(Tri-state)*

## Notes on the sheets
sheet 1
- NC
